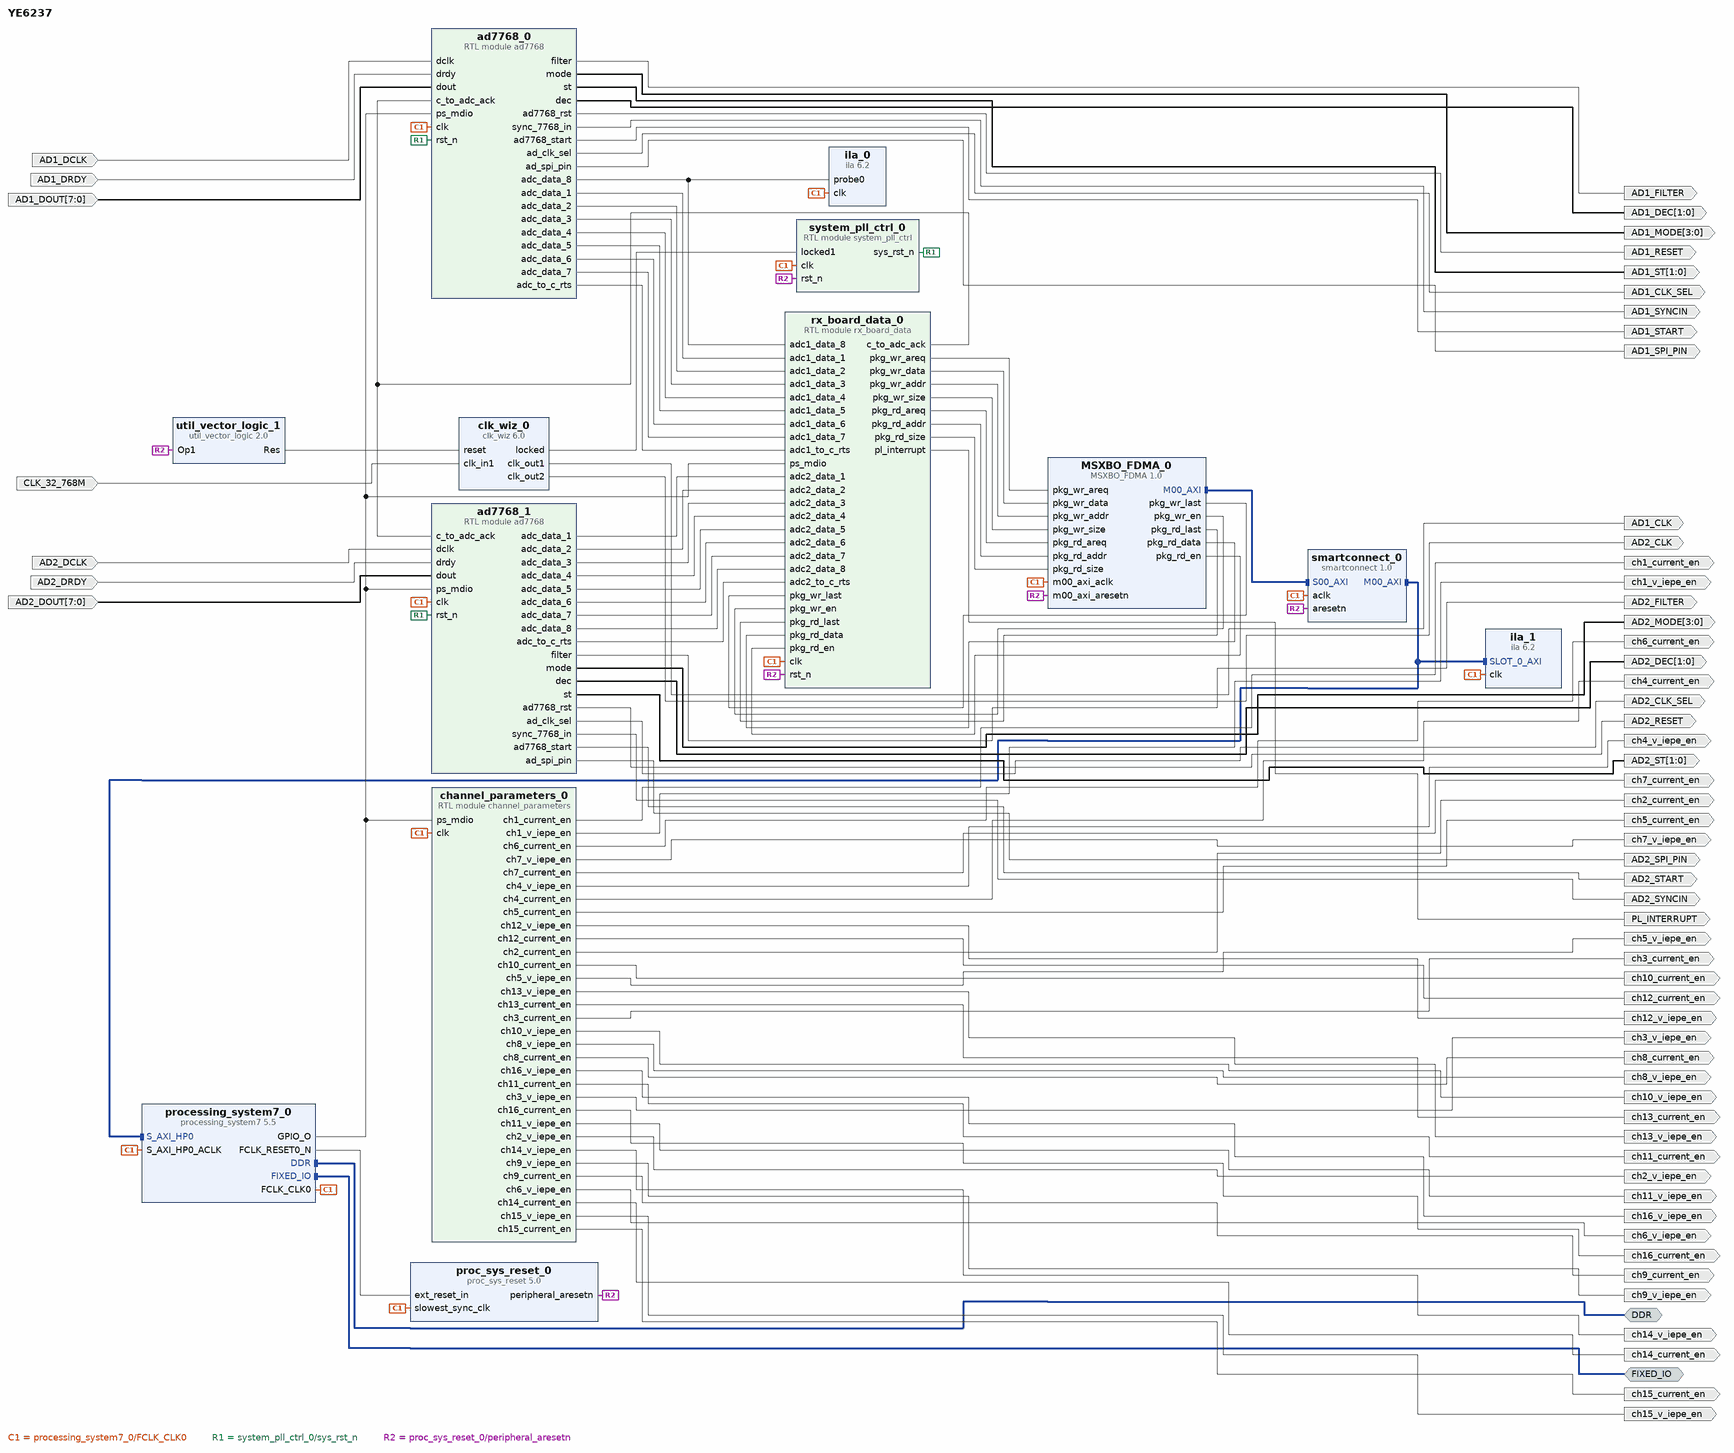
[diagram p0: block diagram of the top level]
# Vivado block design YE6237, xc7z020clg400-2, Vivado 2018.3
create_bd_design YE6237

create_bd_intf_port -mode Master -vlnv xilinx.com:interface:ddrx_rtl:1.0 DDR
create_bd_intf_port -mode Master -vlnv xilinx.com:display_processing_system7:fixedio_rtl:1.0 FIXED_IO
create_bd_port -dir O ch1_current_en
create_bd_port -dir O ch1_v_iepe_en
create_bd_port -dir O ch6_current_en
create_bd_port -dir O ch12_v_iepe_en
create_bd_port -dir O ch12_current_en
create_bd_port -dir O ch7_v_iepe_en
create_bd_port -dir O ch7_current_en
create_bd_port -dir O ch13_v_iepe_en
create_bd_port -dir O ch13_current_en
create_bd_port -dir O ch4_v_iepe_en
create_bd_port -dir O ch4_current_en
create_bd_port -dir O ch16_v_iepe_en
create_bd_port -dir O ch10_v_iepe_en
create_bd_port -dir O ch10_current_en
create_bd_port -dir O ch16_current_en
create_bd_port -dir O ch5_v_iepe_en
create_bd_port -dir O ch5_current_en
create_bd_port -dir O ch11_v_iepe_en
create_bd_port -dir O ch11_current_en
create_bd_port -dir O ch2_current_en
create_bd_port -dir O ch8_v_iepe_en
create_bd_port -dir O ch8_current_en
create_bd_port -dir O ch14_v_iepe_en
create_bd_port -dir O ch3_v_iepe_en
create_bd_port -dir O ch3_current_en
create_bd_port -dir O ch14_current_en
create_bd_port -dir O ch9_v_iepe_en
create_bd_port -dir O ch9_current_en
create_bd_port -dir O ch15_v_iepe_en
create_bd_port -dir O ch15_current_en
create_bd_port -dir O ch6_v_iepe_en
create_bd_port -dir O ch2_v_iepe_en
create_bd_port -dir I -type clk CLK_32_768M
set_property -dict {CONFIG.FREQ_HZ 32768000} [get_bd_ports CLK_32_768M]
create_bd_port -dir O -type clk AD1_CLK
set_property -dict {CONFIG.FREQ_HZ 13107200} [get_bd_ports AD1_CLK]
create_bd_port -dir O -type clk AD2_CLK
set_property -dict {CONFIG.FREQ_HZ 13107200} [get_bd_ports AD2_CLK]
create_bd_port -dir I AD1_DCLK
create_bd_port -dir I AD1_DRDY
create_bd_port -dir I -from 7 -to 0 AD1_DOUT
create_bd_port -dir O AD1_FILTER
create_bd_port -dir O -from 3 -to 0 AD1_MODE
create_bd_port -dir O -from 1 -to 0 AD1_ST
create_bd_port -dir O -from 1 -to 0 AD1_DEC
create_bd_port -dir O -type rst AD1_RESET
create_bd_port -dir O AD1_SYNCIN
create_bd_port -dir O AD1_START
create_bd_port -dir I AD2_DCLK
create_bd_port -dir I AD2_DRDY
create_bd_port -dir I -from 7 -to 0 AD2_DOUT
create_bd_port -dir O AD2_FILTER
create_bd_port -dir O -from 3 -to 0 AD2_MODE
create_bd_port -dir O -from 1 -to 0 AD2_ST
create_bd_port -dir O -from 1 -to 0 AD2_DEC
create_bd_port -dir O -type rst AD2_RESET
create_bd_port -dir O AD2_SYNCIN
create_bd_port -dir O AD2_START
create_bd_port -dir O AD1_CLK_SEL
create_bd_port -dir O AD1_SPI_PIN
create_bd_port -dir O AD2_CLK_SEL
create_bd_port -dir O AD2_SPI_PIN
create_bd_port -dir O -type intr PL_INTERRUPT

create_bd_cell -type ip -vlnv xilinx.com:ip:processing_system7:5.5 processing_system7_0
set_property -dict [list \
  CONFIG.PCW_ENET0_ENET0_IO {MIO 16 .. 27} \
  CONFIG.PCW_ENET0_GRP_MDIO_ENABLE 1 \
  CONFIG.PCW_ENET0_GRP_MDIO_IO {MIO 52 .. 53} \
  CONFIG.PCW_ENET0_PERIPHERAL_ENABLE 1 \
  CONFIG.PCW_ENET0_RESET_ENABLE 1 \
  CONFIG.PCW_ENET0_RESET_IO {MIO 0} \
  CONFIG.PCW_ENET1_PERIPHERAL_CLKSRC External \
  CONFIG.PCW_ENET_RESET_ENABLE 1 \
  CONFIG.PCW_ENET_RESET_SELECT {Share reset pin} \
  CONFIG.PCW_FPGA0_PERIPHERAL_FREQMHZ 100 \
  CONFIG.PCW_GPIO_EMIO_GPIO_ENABLE 1 \
  CONFIG.PCW_GPIO_EMIO_GPIO_IO 21 \
  CONFIG.PCW_GPIO_EMIO_GPIO_WIDTH 21 \
  CONFIG.PCW_GPIO_MIO_GPIO_ENABLE 1 \
  CONFIG.PCW_GPIO_MIO_GPIO_IO MIO \
  CONFIG.PCW_I2C_RESET_ENABLE 1 \
  CONFIG.PCW_PRESET_BANK1_VOLTAGE {LVCMOS 1.8V} \
  CONFIG.PCW_QSPI_GRP_SINGLE_SS_ENABLE 1 \
  CONFIG.PCW_QSPI_GRP_SINGLE_SS_IO {MIO 1 .. 6} \
  CONFIG.PCW_QSPI_PERIPHERAL_ENABLE 1 \
  CONFIG.PCW_QSPI_QSPI_IO {MIO 1 .. 6} \
  CONFIG.PCW_SINGLE_QSPI_DATA_MODE x4 \
  CONFIG.PCW_UART0_PERIPHERAL_ENABLE 1 \
  CONFIG.PCW_UART0_UART0_IO {MIO 14 .. 15} \
  CONFIG.PCW_UART1_PERIPHERAL_ENABLE 1 \
  CONFIG.PCW_UART1_UART1_IO {MIO 8 .. 9} \
  CONFIG.PCW_UART_PERIPHERAL_FREQMHZ 100 \
  CONFIG.PCW_UIPARAM_DDR_PARTNO {MT41J256M16 RE-125} \
  CONFIG.PCW_USB_RESET_ENABLE 1 \
  CONFIG.PCW_USE_M_AXI_GP0 0 \
  CONFIG.PCW_USE_S_AXI_HP0 1 \
] [get_bd_cells processing_system7_0]
# 217 more settings of processing_system7_0 are not shown: defaults, MIO pin electricals, DDR timing, and values the tool derives
create_bd_cell -type ip -vlnv xilinx.com:ip:smartconnect:1.0 smartconnect_0
set_property -dict {CONFIG.NUM_CLKS 1 CONFIG.NUM_SI 1} [get_bd_cells smartconnect_0]
create_bd_cell -type ip -vlnv xilinx.com:ip:clk_wiz:6.0 clk_wiz_0
set_property -dict [list \
  CONFIG.CLKIN1_JITTER_PS 305.17 \
  CONFIG.CLKOUT1_DRIVES BUFG \
  CONFIG.CLKOUT1_JITTER 155.398 \
  CONFIG.CLKOUT1_PHASE_ERROR 151.393 \
  CONFIG.CLKOUT1_REQUESTED_OUT_FREQ 13.1072 \
  CONFIG.CLKOUT1_USED true \
  CONFIG.CLKOUT2_DRIVES BUFG \
  CONFIG.CLKOUT2_JITTER 155.398 \
  CONFIG.CLKOUT2_PHASE_ERROR 151.393 \
  CONFIG.CLKOUT2_REQUESTED_OUT_FREQ 13.1072 \
  CONFIG.CLKOUT2_USED true \
  CONFIG.CLKOUT3_DRIVES BUFG \
  CONFIG.CLKOUT4_DRIVES BUFG \
  CONFIG.CLKOUT5_DRIVES BUFG \
  CONFIG.CLKOUT6_DRIVES BUFG \
  CONFIG.CLKOUT7_DRIVES BUFG \
  CONFIG.JITTER_SEL Min_O_Jitter \
  CONFIG.MMCM_BANDWIDTH HIGH \
  CONFIG.MMCM_CLKFBOUT_MULT_F 50 \
  CONFIG.MMCM_CLKIN1_PERIOD 30.517 \
  CONFIG.MMCM_CLKIN2_PERIOD 10.0 \
  CONFIG.MMCM_CLKOUT0_DIVIDE_F 125 \
  CONFIG.MMCM_CLKOUT1_DIVIDE 125 \
  CONFIG.MMCM_COMPENSATION ZHOLD \
  CONFIG.MMCM_DIVCLK_DIVIDE 1 \
  CONFIG.NUM_OUT_CLKS 2 \
  CONFIG.PRIMITIVE PLL \
  CONFIG.PRIM_IN_FREQ 32.768 \
  CONFIG.PRIM_SOURCE Global_buffer \
] [get_bd_cells clk_wiz_0]
create_bd_cell -type ip -vlnv xilinx.com:ip:util_vector_logic:2.0 util_vector_logic_1
set_property -dict {CONFIG.C_OPERATION not CONFIG.C_SIZE 1} [get_bd_cells util_vector_logic_1]
create_bd_cell -type ip -vlnv xilinx.com:user:MSXBO_FDMA:1.0 MSXBO_FDMA_0
set_property -dict {CONFIG.C_M00_AXI_BURST_LEN 256} [get_bd_cells MSXBO_FDMA_0]
create_bd_cell -type module -reference channel_parameters channel_parameters_0
create_bd_cell -type ip -vlnv xilinx.com:ip:proc_sys_reset:5.0 proc_sys_reset_0
create_bd_cell -type module -reference system_pll_ctrl system_pll_ctrl_0
create_bd_cell -type ip -vlnv xilinx.com:ip:ila:6.2 ila_0
set_property -dict [list \
  CONFIG.C_DATA_DEPTH 8192 \
  CONFIG.C_ENABLE_ILA_AXI_MON false \
  CONFIG.C_MONITOR_TYPE Native \
  CONFIG.C_NUM_OF_PROBES 1 \
  CONFIG.C_PROBE0_WIDTH 32 \
] [get_bd_cells ila_0]
create_bd_cell -type ip -vlnv xilinx.com:ip:ila:6.2 ila_1
set_property -dict {CONFIG.C_DATA_DEPTH 8192} [get_bd_cells ila_1]
create_bd_cell -type module -reference ad7768 ad7768_0
create_bd_cell -type module -reference ad7768 ad7768_1
create_bd_cell -type module -reference rx_board_data rx_board_data_0

# ---- connections ----

connect_bd_intf_net [get_bd_intf_pins smartconnect_0/M00_AXI] [get_bd_intf_pins processing_system7_0/S_AXI_HP0]
connect_bd_intf_net [get_bd_intf_pins smartconnect_0/M00_AXI] [get_bd_intf_pins ila_1/SLOT_0_AXI]
connect_bd_intf_net [get_bd_intf_ports DDR] [get_bd_intf_pins processing_system7_0/DDR]
connect_bd_intf_net [get_bd_intf_ports FIXED_IO] [get_bd_intf_pins processing_system7_0/FIXED_IO]
connect_bd_intf_net [get_bd_intf_pins MSXBO_FDMA_0/M00_AXI] [get_bd_intf_pins smartconnect_0/S00_AXI]
connect_bd_net [get_bd_pins processing_system7_0/GPIO_O] \
  [get_bd_pins channel_parameters_0/ps_mdio] [get_bd_pins ad7768_0/ps_mdio] [get_bd_pins ad7768_1/ps_mdio] \
  [get_bd_pins rx_board_data_0/ps_mdio]
connect_bd_net -net clk_wiz_0_clk_out1 [get_bd_pins processing_system7_0/FCLK_CLK0] \
  [get_bd_pins smartconnect_0/aclk] [get_bd_pins processing_system7_0/S_AXI_HP0_ACLK] [get_bd_pins MSXBO_FDMA_0/m00_axi_aclk] \
  [get_bd_pins channel_parameters_0/clk] [get_bd_pins proc_sys_reset_0/slowest_sync_clk] [get_bd_pins system_pll_ctrl_0/clk] \
  [get_bd_pins ila_1/clk] [get_bd_pins ila_0/clk] [get_bd_pins ad7768_0/clk] [get_bd_pins ad7768_1/clk] \
  [get_bd_pins rx_board_data_0/clk]
connect_bd_net [get_bd_pins channel_parameters_0/ch1_current_en] [get_bd_ports ch1_current_en]
connect_bd_net [get_bd_pins channel_parameters_0/ch1_v_iepe_en] [get_bd_ports ch1_v_iepe_en]
connect_bd_net [get_bd_pins channel_parameters_0/ch6_current_en] [get_bd_ports ch6_current_en]
connect_bd_net [get_bd_pins channel_parameters_0/ch12_v_iepe_en] [get_bd_ports ch12_v_iepe_en]
connect_bd_net [get_bd_pins channel_parameters_0/ch12_current_en] [get_bd_ports ch12_current_en]
connect_bd_net [get_bd_pins channel_parameters_0/ch7_v_iepe_en] [get_bd_ports ch7_v_iepe_en]
connect_bd_net [get_bd_pins channel_parameters_0/ch7_current_en] [get_bd_ports ch7_current_en]
connect_bd_net [get_bd_pins channel_parameters_0/ch13_v_iepe_en] [get_bd_ports ch13_v_iepe_en]
connect_bd_net [get_bd_pins channel_parameters_0/ch13_current_en] [get_bd_ports ch13_current_en]
connect_bd_net [get_bd_pins channel_parameters_0/ch4_v_iepe_en] [get_bd_ports ch4_v_iepe_en]
connect_bd_net [get_bd_pins channel_parameters_0/ch4_current_en] [get_bd_ports ch4_current_en]
connect_bd_net [get_bd_pins channel_parameters_0/ch16_v_iepe_en] [get_bd_ports ch16_v_iepe_en]
connect_bd_net [get_bd_pins channel_parameters_0/ch10_v_iepe_en] [get_bd_ports ch10_v_iepe_en]
connect_bd_net [get_bd_pins channel_parameters_0/ch10_current_en] [get_bd_ports ch10_current_en]
connect_bd_net [get_bd_pins channel_parameters_0/ch16_current_en] [get_bd_ports ch16_current_en]
connect_bd_net [get_bd_pins channel_parameters_0/ch5_v_iepe_en] [get_bd_ports ch5_v_iepe_en]
connect_bd_net [get_bd_pins channel_parameters_0/ch5_current_en] [get_bd_ports ch5_current_en]
connect_bd_net [get_bd_pins channel_parameters_0/ch11_v_iepe_en] [get_bd_ports ch11_v_iepe_en]
connect_bd_net [get_bd_pins channel_parameters_0/ch11_current_en] [get_bd_ports ch11_current_en]
connect_bd_net [get_bd_pins channel_parameters_0/ch2_current_en] [get_bd_ports ch2_current_en]
connect_bd_net [get_bd_pins channel_parameters_0/ch8_v_iepe_en] [get_bd_ports ch8_v_iepe_en]
connect_bd_net [get_bd_pins channel_parameters_0/ch8_current_en] [get_bd_ports ch8_current_en]
connect_bd_net [get_bd_pins channel_parameters_0/ch14_v_iepe_en] [get_bd_ports ch14_v_iepe_en]
connect_bd_net [get_bd_pins channel_parameters_0/ch3_v_iepe_en] [get_bd_ports ch3_v_iepe_en]
connect_bd_net [get_bd_pins channel_parameters_0/ch3_current_en] [get_bd_ports ch3_current_en]
connect_bd_net [get_bd_pins channel_parameters_0/ch14_current_en] [get_bd_ports ch14_current_en]
connect_bd_net [get_bd_pins channel_parameters_0/ch9_v_iepe_en] [get_bd_ports ch9_v_iepe_en]
connect_bd_net [get_bd_pins channel_parameters_0/ch9_current_en] [get_bd_ports ch9_current_en]
connect_bd_net [get_bd_pins channel_parameters_0/ch15_v_iepe_en] [get_bd_ports ch15_v_iepe_en]
connect_bd_net [get_bd_pins channel_parameters_0/ch15_current_en] [get_bd_ports ch15_current_en]
connect_bd_net [get_bd_pins channel_parameters_0/ch6_v_iepe_en] [get_bd_ports ch6_v_iepe_en]
connect_bd_net [get_bd_pins channel_parameters_0/ch2_v_iepe_en] [get_bd_ports ch2_v_iepe_en]
connect_bd_net [get_bd_pins clk_wiz_0/locked] [get_bd_pins system_pll_ctrl_0/locked1]
connect_bd_net [get_bd_ports CLK_32_768M] [get_bd_pins clk_wiz_0/clk_in1]
connect_bd_net [get_bd_pins clk_wiz_0/clk_out1] [get_bd_ports AD1_CLK]
connect_bd_net [get_bd_pins clk_wiz_0/clk_out2] [get_bd_ports AD2_CLK]
connect_bd_net [get_bd_pins util_vector_logic_1/Res] [get_bd_pins clk_wiz_0/reset]
connect_bd_net [get_bd_pins system_pll_ctrl_0/sys_rst_n] [get_bd_pins ad7768_0/rst_n] [get_bd_pins ad7768_1/rst_n]
connect_bd_net -net dclk_0_1 [get_bd_ports AD1_DCLK] [get_bd_pins ad7768_0/dclk]
connect_bd_net -net drdy_0_1 [get_bd_ports AD1_DRDY] [get_bd_pins ad7768_0/drdy]
connect_bd_net -net dout_0_1 [get_bd_ports AD1_DOUT] [get_bd_pins ad7768_0/dout]
connect_bd_net [get_bd_pins ad7768_0/filter] [get_bd_ports AD1_FILTER]
connect_bd_net [get_bd_pins ad7768_0/mode] [get_bd_ports AD1_MODE]
connect_bd_net [get_bd_pins ad7768_0/st] [get_bd_ports AD1_ST]
connect_bd_net [get_bd_pins ad7768_0/dec] [get_bd_ports AD1_DEC]
connect_bd_net [get_bd_pins ad7768_0/ad7768_rst] [get_bd_ports AD1_RESET]
connect_bd_net [get_bd_pins ad7768_0/sync_7768_in] [get_bd_ports AD1_SYNCIN]
connect_bd_net [get_bd_pins ad7768_0/ad7768_start] [get_bd_ports AD1_START]
connect_bd_net -net dclk_0_2 [get_bd_ports AD2_DCLK] [get_bd_pins ad7768_1/dclk]
connect_bd_net -net drdy_0_2 [get_bd_ports AD2_DRDY] [get_bd_pins ad7768_1/drdy]
connect_bd_net -net dout_0_2 [get_bd_ports AD2_DOUT] [get_bd_pins ad7768_1/dout]
connect_bd_net [get_bd_pins ad7768_1/filter] [get_bd_ports AD2_FILTER]
connect_bd_net [get_bd_pins ad7768_1/mode] [get_bd_ports AD2_MODE]
connect_bd_net [get_bd_pins ad7768_1/st] [get_bd_ports AD2_ST]
connect_bd_net [get_bd_pins ad7768_1/dec] [get_bd_ports AD2_DEC]
connect_bd_net [get_bd_pins ad7768_1/ad7768_rst] [get_bd_ports AD2_RESET]
connect_bd_net [get_bd_pins ad7768_1/sync_7768_in] [get_bd_ports AD2_SYNCIN]
connect_bd_net [get_bd_pins ad7768_1/ad7768_start] [get_bd_ports AD2_START]
connect_bd_net [get_bd_pins rx_board_data_0/c_to_adc_ack] [get_bd_pins ad7768_0/c_to_adc_ack] [get_bd_pins ad7768_1/c_to_adc_ack]
connect_bd_net [get_bd_pins ad7768_0/adc_data_1] [get_bd_pins rx_board_data_0/adc1_data_1]
connect_bd_net [get_bd_pins ad7768_0/adc_data_2] [get_bd_pins rx_board_data_0/adc1_data_2]
connect_bd_net [get_bd_pins ad7768_0/adc_data_3] [get_bd_pins rx_board_data_0/adc1_data_3]
connect_bd_net [get_bd_pins ad7768_0/adc_data_4] [get_bd_pins rx_board_data_0/adc1_data_4]
connect_bd_net [get_bd_pins ad7768_0/adc_data_5] [get_bd_pins rx_board_data_0/adc1_data_5]
connect_bd_net [get_bd_pins ad7768_0/adc_data_6] [get_bd_pins rx_board_data_0/adc1_data_6]
connect_bd_net [get_bd_pins ad7768_0/adc_data_7] [get_bd_pins rx_board_data_0/adc1_data_7]
connect_bd_net [get_bd_pins ad7768_0/adc_data_8] [get_bd_pins ila_0/probe0] [get_bd_pins rx_board_data_0/adc1_data_8]
connect_bd_net [get_bd_pins ad7768_0/adc_to_c_rts] [get_bd_pins rx_board_data_0/adc1_to_c_rts]
connect_bd_net [get_bd_pins ad7768_1/adc_data_1] [get_bd_pins rx_board_data_0/adc2_data_1]
connect_bd_net [get_bd_pins ad7768_1/adc_data_2] [get_bd_pins rx_board_data_0/adc2_data_2]
connect_bd_net [get_bd_pins ad7768_1/adc_data_3] [get_bd_pins rx_board_data_0/adc2_data_3]
connect_bd_net [get_bd_pins ad7768_1/adc_data_4] [get_bd_pins rx_board_data_0/adc2_data_4]
connect_bd_net [get_bd_pins ad7768_1/adc_data_5] [get_bd_pins rx_board_data_0/adc2_data_5]
connect_bd_net [get_bd_pins ad7768_1/adc_data_6] [get_bd_pins rx_board_data_0/adc2_data_6]
connect_bd_net [get_bd_pins ad7768_1/adc_data_7] [get_bd_pins rx_board_data_0/adc2_data_7]
connect_bd_net [get_bd_pins ad7768_1/adc_data_8] [get_bd_pins rx_board_data_0/adc2_data_8]
connect_bd_net [get_bd_pins ad7768_1/adc_to_c_rts] [get_bd_pins rx_board_data_0/adc2_to_c_rts]
connect_bd_net [get_bd_pins MSXBO_FDMA_0/pkg_wr_last] [get_bd_pins rx_board_data_0/pkg_wr_last]
connect_bd_net [get_bd_pins MSXBO_FDMA_0/pkg_wr_en] [get_bd_pins rx_board_data_0/pkg_wr_en]
connect_bd_net [get_bd_pins rx_board_data_0/pkg_wr_areq] [get_bd_pins MSXBO_FDMA_0/pkg_wr_areq]
connect_bd_net [get_bd_pins rx_board_data_0/pkg_wr_data] [get_bd_pins MSXBO_FDMA_0/pkg_wr_data]
connect_bd_net [get_bd_pins rx_board_data_0/pkg_wr_addr] [get_bd_pins MSXBO_FDMA_0/pkg_wr_addr]
connect_bd_net [get_bd_pins rx_board_data_0/pkg_wr_size] [get_bd_pins MSXBO_FDMA_0/pkg_wr_size]
connect_bd_net [get_bd_pins rx_board_data_0/pkg_rd_areq] [get_bd_pins MSXBO_FDMA_0/pkg_rd_areq]
connect_bd_net [get_bd_pins rx_board_data_0/pkg_rd_addr] [get_bd_pins MSXBO_FDMA_0/pkg_rd_addr]
connect_bd_net [get_bd_pins rx_board_data_0/pkg_rd_size] [get_bd_pins MSXBO_FDMA_0/pkg_rd_size]
connect_bd_net [get_bd_pins MSXBO_FDMA_0/pkg_rd_last] [get_bd_pins rx_board_data_0/pkg_rd_last]
connect_bd_net [get_bd_pins MSXBO_FDMA_0/pkg_rd_data] [get_bd_pins rx_board_data_0/pkg_rd_data]
connect_bd_net [get_bd_pins MSXBO_FDMA_0/pkg_rd_en] [get_bd_pins rx_board_data_0/pkg_rd_en]
connect_bd_net [get_bd_pins ad7768_0/ad_clk_sel] [get_bd_ports AD1_CLK_SEL]
connect_bd_net [get_bd_pins ad7768_0/ad_spi_pin] [get_bd_ports AD1_SPI_PIN]
connect_bd_net [get_bd_pins ad7768_1/ad_clk_sel] [get_bd_ports AD2_CLK_SEL]
connect_bd_net [get_bd_pins ad7768_1/ad_spi_pin] [get_bd_ports AD2_SPI_PIN]
connect_bd_net [get_bd_pins processing_system7_0/FCLK_RESET0_N] [get_bd_pins proc_sys_reset_0/ext_reset_in]
connect_bd_net [get_bd_pins proc_sys_reset_0/peripheral_aresetn] \
  [get_bd_pins smartconnect_0/aresetn] [get_bd_pins MSXBO_FDMA_0/m00_axi_aresetn] [get_bd_pins util_vector_logic_1/Op1] \
  [get_bd_pins system_pll_ctrl_0/rst_n] [get_bd_pins rx_board_data_0/rst_n]
connect_bd_net [get_bd_pins rx_board_data_0/pl_interrupt] [get_bd_ports PL_INTERRUPT]

# ---- address map ----
assign_bd_address -offset 0x00000000 -range 1G -target_address_space [get_bd_addr_spaces MSXBO_FDMA_0/M00_AXI] [get_bd_addr_segs processing_system7_0/S_AXI_HP0/HP0_DDR_LOWOCM]

validate_bd_design
save_bd_design
